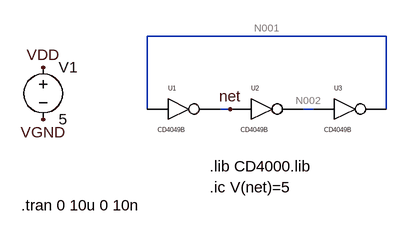
[diagram p0: schematic Design1.asc]
Design1.asc, the LTspice schematic file:
Version 4
SHEET 1 880 680
WIRE 544 48 176 48
WIRE 176 160 176 48
WIRE 304 160 288 160
WIRE 432 160 416 160
WIRE 544 160 544 48
FLAG 16 96 VDD
FLAG 16 176 VGND
FLAG 304 160 net
SYMBOL CD4000\\CD4049B 480 96 R0
SYMATTR InstName U3
SYMBOL voltage 16 80 R0
WINDOW 123 0 0 Left 0
WINDOW 39 0 0 Left 0
SYMATTR InstName V1
SYMATTR Value 5
SYMBOL CD4000\\CD4049B 352 96 R0
SYMATTR InstName U2
SYMBOL CD4000\\CD4049B 224 96 R0
SYMATTR InstName U1
TEXT 272 248 Left 2 !.lib CD4000.lib
TEXT -18 308 Left 2 !.tran 0 10u 0 10n
TEXT 272 280 Left 2 !.ic V(net)=5

The netlist it stands for:
* Design1.asc
XU3 N002 N001 VDD 0 CD4049B VDD=5  SPEED=1.0  TRIPDT=5e-9  ; pins A Y
V1 VDD VGND 5
XU2 net N002 VDD 0 CD4049B VDD=5  SPEED=1.0  TRIPDT=5e-9  ; pins A Y
XU1 N001 net VDD 0 CD4049B VDD=5  SPEED=1.0  TRIPDT=5e-9  ; pins A Y
.lib CD4000.lib
.tran 0 10u 0 10n
.ic V(net)=5
.backanno
.end

* Results of the author's LTspice run, read from the files saved beside the schematic
* Operating Point, zero values left out:
*   V(n001) = 5 V
*   V(vdd) = 5 V
*   V(net) = 5 V
*   Ix(u3:Y) = -50 nA
*   Ix(u3:VGND) = 50 nA
*   Ix(u2:A) = 50 nA
*   Ix(u2:VGND) = -50 nA
*   Ix(u1:A) = 50 nA
*   Ix(u1:Y) = 20 mA
*   Ix(u1:VGND) = -20 mA
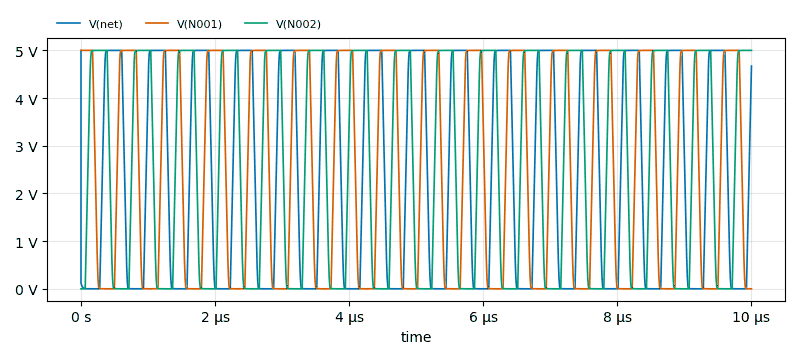
[diagram p1: Transient Analysis of Design1.asc, plotted from the saved traces]
* Transient Analysis, 1 run:
*   V(net): min 0 V, max 5 V, average 2.434 V, rms 3.332 V, last 4.672 V
*   V(N001): min 0 V, max 5 V, average 2.515 V, rms 3.392 V, last 104.9 µV
*   V(N002): min 0 V, max 5 V, average 2.53 V, rms 3.402 V, last 5 V